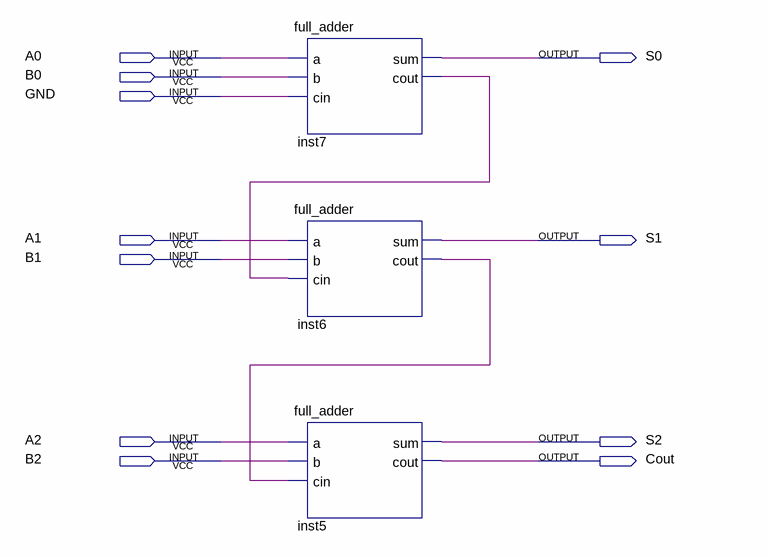
[diagram p0: schematic sheet]
// Quartus schematic 3-bit_adder.bdf as structural Verilog: 3 symbols, 11 pins
module \3-bit_adder  (
  input  A0,
  input  B0,
  input  GND,
  input  A1,
  input  B1,
  input  A2,
  input  B2,
  output S0,
  output S1,
  output S2,
  output Cout
);

  wire inst6_cout, inst7_cout;

  full_adder inst7 (.a(A0), .b(B0), .cin(GND), .sum(S0), .cout(inst7_cout));
  full_adder inst6 (.a(A1), .b(B1), .cin(inst7_cout), .sum(S1), .cout(inst6_cout));
  full_adder inst5 (.a(A2), .b(B2), .cin(inst6_cout), .sum(S2), .cout(Cout));
endmodule
